# Altium schematic sheet RP2350_MCU.SchDoc
size A3; SheetNumber: 3; SheetTotal: 5
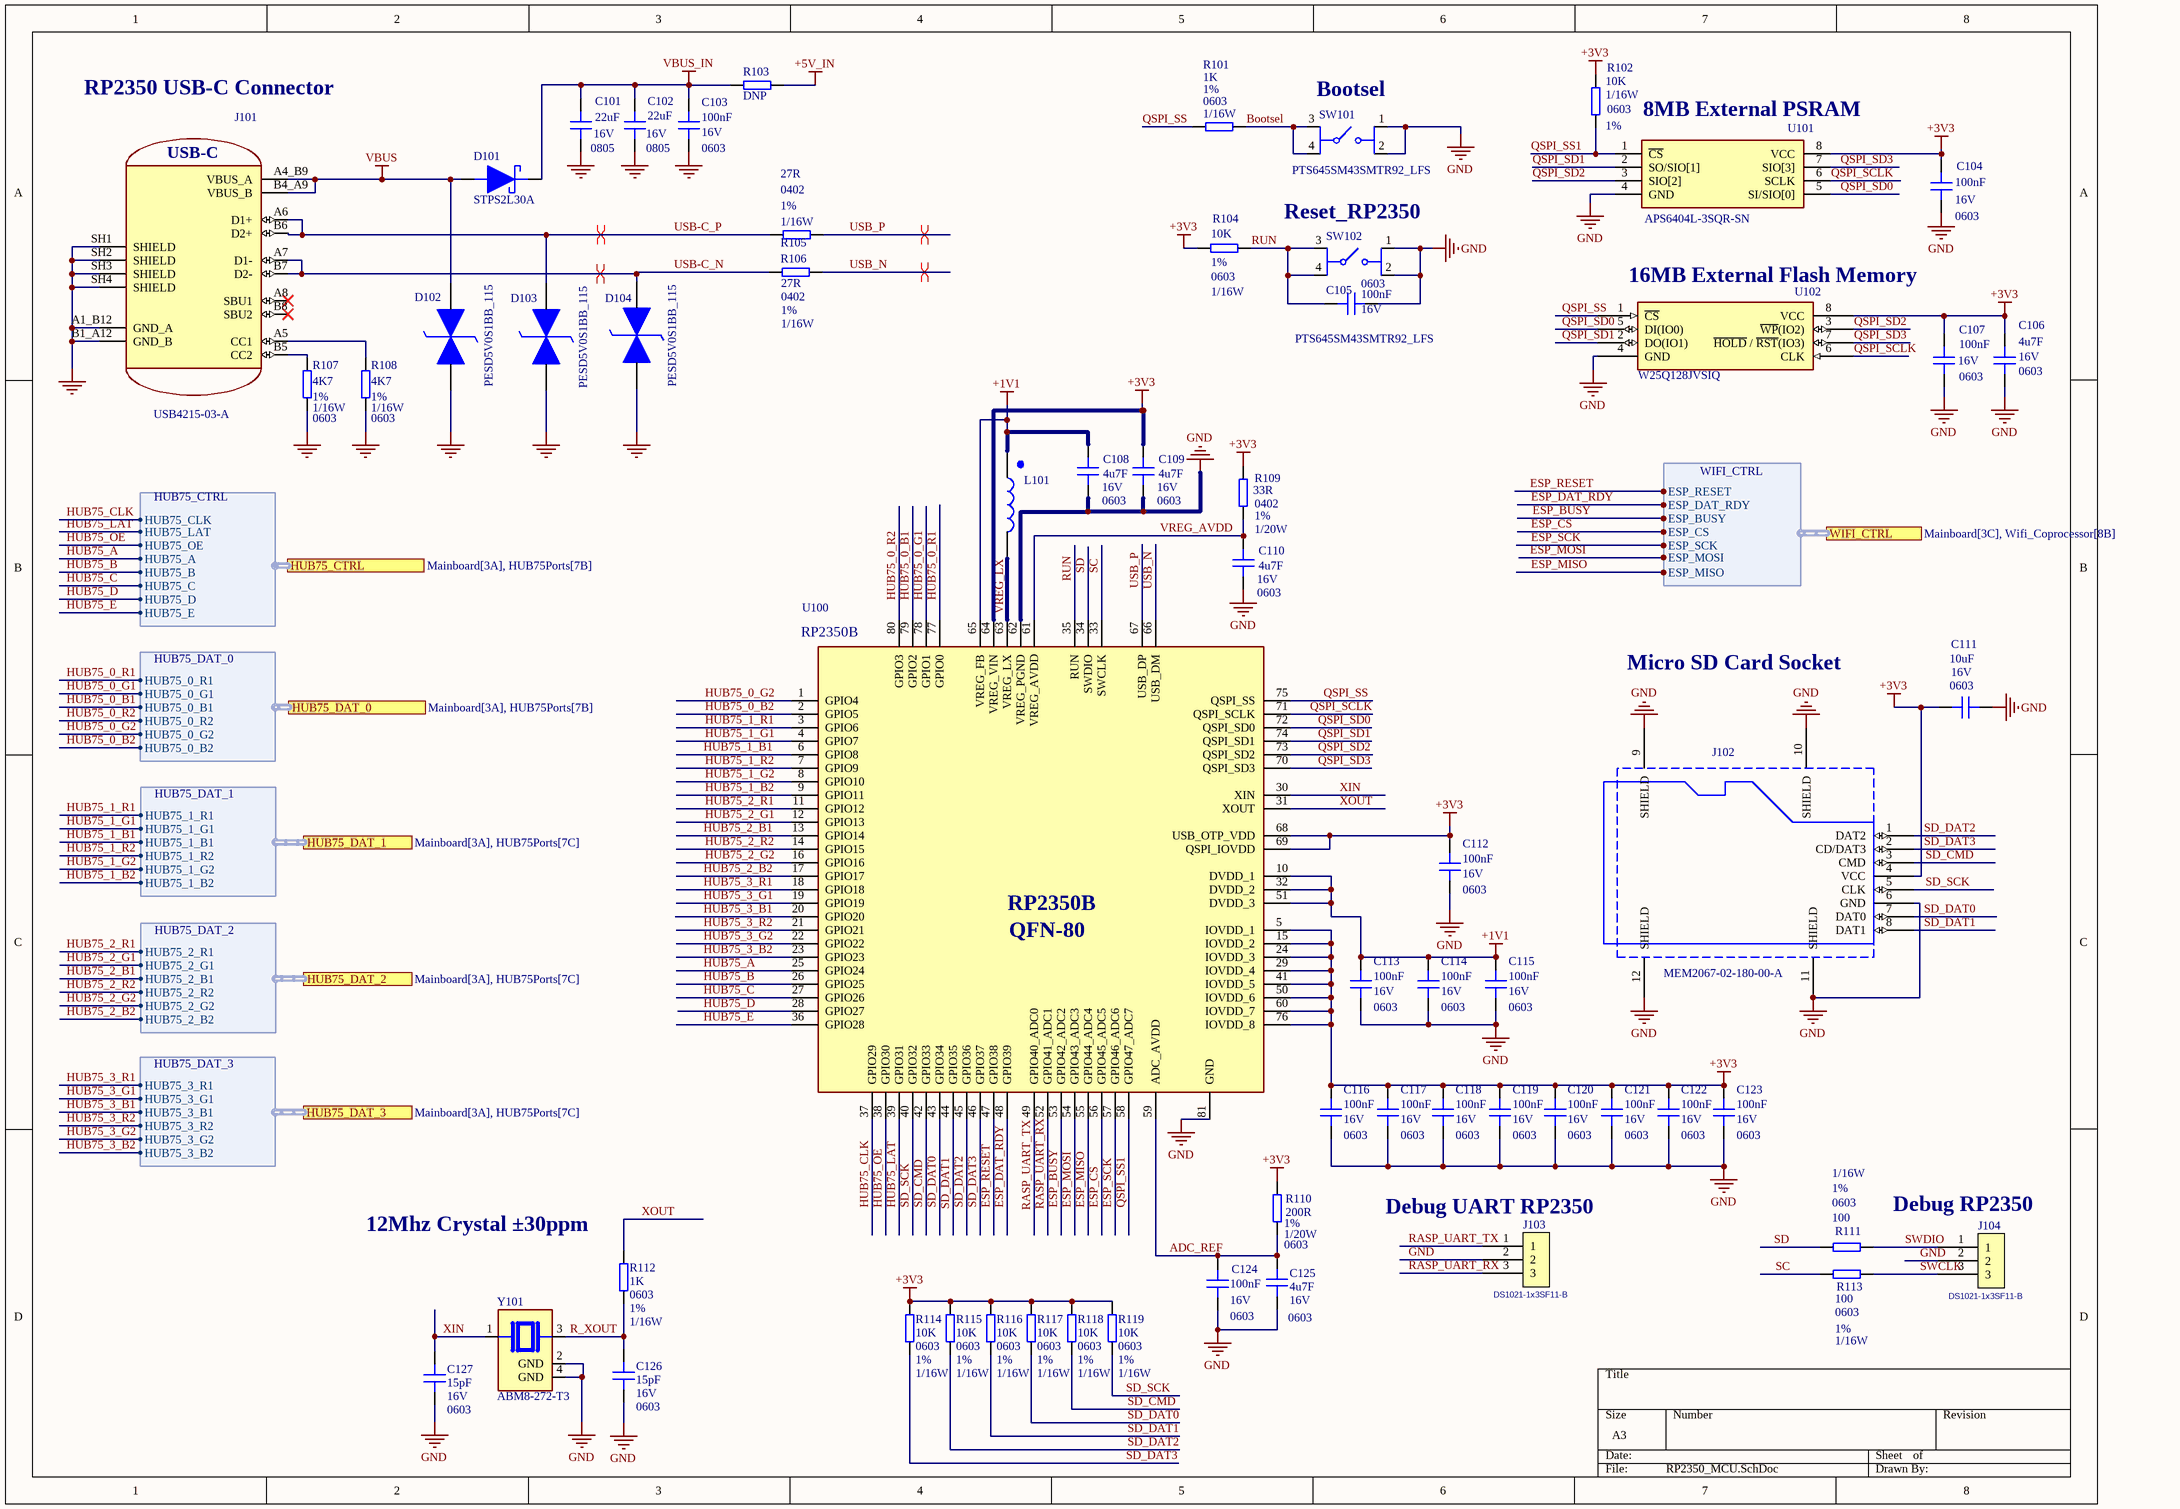
[diagram p0: RP2350_MCU.SchDoc]

## Parts
C101  22uF  Voltage: 16V  Package: 0805  [C0805]
C102  22uF  Voltage: 16V  Package: 0805  [C0805]
C103  100nF  Voltage: 16V  Package: 0603  [C0603]
C104  100nF  Voltage: 16V  Package: 0603  [C0603]
C105  100nF  Voltage: 16V  Package: 0603  [C0603]
C106  4u7F  Voltage: 16V  Package: 0603  [C0603]
C107  100nF  Voltage: 16V  Package: 0603  [C0603]
C108  4u7F  Voltage: 16V  Package: 0603  [C0603]
C109  4u7F  Voltage: 16V  Package: 0603  [C0603]
C110  4u7F  Voltage: 16V  Package: 0603  [C0603]
C111  10uF  Voltage: 16V  Package: 0603  [C0603]
C112  100nF  Voltage: 16V  Package: 0603  [C0402]
C113  100nF  Voltage: 16V  Package: 0603  [C0603]
C114  100nF  Voltage: 16V  Package: 0603  [C0603]
C115  100nF  Voltage: 16V  Package: 0603  [C0603]
C116  100nF  Voltage: 16V  Package: 0603  [C0603]
C117  100nF  Voltage: 16V  Package: 0603  [C0603]
C118  100nF  Voltage: 16V  Package: 0603  [C0603]
C119  100nF  Voltage: 16V  Package: 0603  [C0603]
C120  100nF  Voltage: 16V  Package: 0603  [C0603]
C121  100nF  Voltage: 16V  Package: 0603  [C0603]
C122  100nF  Voltage: 16V  Package: 0603  [C0603]
C123  100nF  Voltage: 16V  Package: 0603  [C0603]
C124  100nF  Voltage: 16V  Package: 0603  [C0603]
C125  4u7F  Voltage: 16V  Package: 0603  [C0603]
C126  15pF  Voltage: 16V  Package: 0603  [C0603]
C127  15pF  Voltage: 16V  Package: 0603  [C0603]
D101  STPS2L30A  [SMA_STM]
D102  PESD5V0S1BB_115  [SODFL1608X65N]
D103  PESD5V0S1BB_115  [SODFL1608X65N]
D104  PESD5V0S1BB_115  [SODFL1608X65N]
J101  USB4215-03-A  [GCT_USB4215-03-A_REVA]
J102  MEM2067-02-180-00-A  [GCT_MEM2067-02-180-00-A_REVB]
J103  DS1021-1x3SF11-B  [HDR-TH_3P-P2.54-V-M]
J104  DS1021-1x3SF11-B  [HDR-TH_3P-P2.54-V-M]
L101  AOTA-B201610S3R3-101-T  [AOTAB201610S3R3101T]  (value not drawn)
R101  1K  Package: 0603  Tolerence: 1%  Power: 1/16W  [R0603_1608]
R102  10K  Package: 0603  Tolerence: 1%  Power: 1/16W  [R0603_1608]
R103  DNP  [R0805_2012]
R104  10K  Package: 0603  Tolerence: 1%  Power: 1/16W  [R0603_1608]
R105  27R  Package: 0402  Tolerence: 1%  Power: 1/16W  [R0402_1005]
R106  27R  Package: 0402  Tolerence: 1%  Power: 1/16W  [R0402_1005]
R107  4K7  Package: 0603  Tolerence: 1%  Power: 1/16W  [R0603_1608]
R108  4K7  Package: 0603  Tolerence: 1%  Power: 1/16W  [R0603_1608]
R109  33R  Package: 0402  Tolerence: 1%  Power: 1/20W  [R0402_1005]
R110  200R  Package: 0603  Tolerence: 1%  Power: 1/20W  [R0603_1608]
R111  100  Package: 0603  Tolerence: 1%  Power: 1/16W  [R0603_1608]
R112  1K  Package: 0603  Tolerence: 1%  Power: 1/16W  [R0603_1608]
R113  100  Package: 0603  Tolerence: 1%  Power: 1/16W  [R0603_1608]
R114  10K  Package: 0603  Tolerence: 1%  Power: 1/16W  [R0603_1608]
R115  10K  Package: 0603  Tolerence: 1%  Power: 1/16W  [R0603_1608]
R116  10K  Package: 0603  Tolerence: 1%  Power: 1/16W  [R0603_1608]
R117  10K  Package: 0603  Tolerence: 1%  Power: 1/16W  [R0603_1608]
R118  10K  Package: 0603  Tolerence: 1%  Power: 1/16W  [R0603_1608]
R119  10K  Package: 0603  Tolerence: 1%  Power: 1/16W  [R0603_1608]
SW101  PTS645SM43SMTR92_LFS  [PTS645SM43SMTR92LFS]
SW102  PTS645SM43SMTR92_LFS  [PTS645SM43SMTR92LFS]
U100  RP2350B  [QFN40P1000X1000X90-81N-D]
U101  APS6404L-3SQR-SN  [SOIC127P600X175-8N]
U102  W25Q128JVSIQ  [SOIC127P790X216-8N]
Y101  ABM8-272-T3  [XTAL_ABM8-272-T3]

## Ports
HUB75_CTRL (harness HUB75_CTRL, see Mainboard[3A], HUB75Ports[7B]), HUB75_DAT_0 (harness HUB75_DAT_0, see Mainboard[3A], HUB75Ports[7B]), HUB75_DAT_1 (harness HUB75_DAT_1, see Mainboard[3A], HUB75Ports[7C]), HUB75_DAT_2 (harness HUB75_DAT_2, see Mainboard[3A], HUB75Ports[7C]), HUB75_DAT_3 (harness HUB75_DAT_3, see Mainboard[3A], HUB75Ports[7C]), WIFI_CTRL (harness WIFI_CTRL, see Mainboard[3C], Wifi_Coprocessor[8B])

## Harnesses
WIFI_CTRL: ESP_RESET, ESP_DAT_RDY, ESP_BUSY, ESP_CS, ESP_SCK, ESP_MOSI, ESP_MISO
HUB75_CTRL: HUB75_CLK, HUB75_LAT, HUB75_OE, HUB75_A, HUB75_B, HUB75_C, HUB75_D, HUB75_E
HUB75_DAT_0: HUB75_0_R1, HUB75_0_G1, HUB75_0_B1, HUB75_0_R2, HUB75_0_G2, HUB75_0_B2
HUB75_DAT_1: HUB75_1_R1, HUB75_1_G1, HUB75_1_B1, HUB75_1_R2, HUB75_1_G2, HUB75_1_B2
HUB75_DAT_2: HUB75_2_R1, HUB75_2_G1, HUB75_2_B1, HUB75_2_R2, HUB75_2_G2, HUB75_2_B2
HUB75_DAT_3: HUB75_3_R1, HUB75_3_G1, HUB75_3_B1, HUB75_3_R2, HUB75_3_G2, HUB75_3_B2

## Nets
+1V1: C108.2 C113.2 C114.2 C115.2 L101.1 U100.10(DVDD_1) U100.32(DVDD_2) U100.51(DVDD_3) U100.65(VREG_FB)
+3V3: C104.2 C106.2 C107.2 C109.2 C111.2 C112.2 C116.2 C117.2 C118.2 C119.2 C120.2 C121.2 C122.2 C123.2 J102.4(VCC) R102.2 R104.1 R109.2 R110.2 R114.1 R115.1 R116.1 R117.1 R118.1 R119.1 U100.5(IOVDD_1) U100.15(IOVDD_2) U100.24(IOVDD_3) U100.29(IOVDD_4) U100.41(IOVDD_5) U100.50(IOVDD_6) U100.60(IOVDD_7) U100.64(VREG_VIN) U100.68(USB_OTP_VDD) U100.69(QSPI_IOVDD) U100.76(IOVDD_8) U101.8(VCC) U102.8(VCC)
+5V_IN: R103.2
GND: C101.1 C102.1 C103.1 C104.1 C105.1 C106.1 C107.1 C108.1 C109.1 C110.1 C111.1 C112.1 C113.1 C114.1 C115.1 C116.1 C117.1 C118.1 C119.1 C120.1 C121.1 C122.1 C123.1 C124.1 C125.1 C126.1 C127.1 D102.1(K1) D103.1(K1) D104.1(K1) J101.A1_B12(GND_A) J101.B1_A12(GND_B) J101.SH1(SHIELD) J101.SH2(SHIELD) J101.SH3(SHIELD) J101.SH4(SHIELD) J102.6(GND) J102.9(SHIELD) J102.10(SHIELD) J102.11(SHIELD) J102.12(SHIELD) J103.2 J104.2 R107.1 R108.1 SW101.1(NO_1) SW101.2(NO_2) SW102.1(NO_1) SW102.2(NO_2) U100.62(VREG_PGND) U100.81(GND) U101.4(GND) U102.4(GND) Y101.2(GND) Y101.4(GND)
VBUS: D101.2(A) D102.2(K2) J101.A4_B9(VBUS_A) J101.B4_A9(VBUS_B)
VBUS_IN: C101.2 C102.2 C103.2 D101.1(K) R103.1
ADC_REF: C124.2 C125.2 R110.1 U100.59(ADC_AVDD)
Bootsel: R101.2 SW101.3(COM_1) SW101.4(COM_2)
ESP_BUSY: U100.53(GPIO42_ADC2) ; port WIFI_CTRL.ESP_BUSY
ESP_CS: U100.56(GPIO45_ADC5) ; port WIFI_CTRL.ESP_CS
ESP_DAT_RDY: U100.48(GPIO39) ; port WIFI_CTRL.ESP_DAT_RDY
ESP_MISO: U100.55(GPIO44_ADC4) ; port WIFI_CTRL.ESP_MISO
ESP_MOSI: U100.54(GPIO43_ADC3) ; port WIFI_CTRL.ESP_MOSI
ESP_RESET: U100.47(GPIO38) ; port WIFI_CTRL.ESP_RESET
ESP_SCK: U100.57(GPIO46_ADC6) ; port WIFI_CTRL.ESP_SCK
HUB75_0_B1: U100.79(GPIO2) ; port HUB75_DAT_0.HUB75_0_B1
HUB75_0_B2: U100.2(GPIO5) ; port HUB75_DAT_0.HUB75_0_B2
HUB75_0_G1: U100.78(GPIO1) ; port HUB75_DAT_0.HUB75_0_G1
HUB75_0_G2: U100.1(GPIO4) ; port HUB75_DAT_0.HUB75_0_G2
HUB75_0_R1: U100.77(GPIO0) ; port HUB75_DAT_0.HUB75_0_R1
HUB75_0_R2: U100.80(GPIO3) ; port HUB75_DAT_0.HUB75_0_R2
HUB75_1_B1: U100.6(GPIO8) ; port HUB75_DAT_1.HUB75_1_B1
HUB75_1_B2: U100.9(GPIO11) ; port HUB75_DAT_1.HUB75_1_B2
HUB75_1_G1: U100.4(GPIO7) ; port HUB75_DAT_1.HUB75_1_G1
HUB75_1_G2: U100.8(GPIO10) ; port HUB75_DAT_1.HUB75_1_G2
HUB75_1_R1: U100.3(GPIO6) ; port HUB75_DAT_1.HUB75_1_R1
HUB75_1_R2: U100.7(GPIO9) ; port HUB75_DAT_1.HUB75_1_R2
HUB75_2_B1: U100.13(GPIO14) ; port HUB75_DAT_2.HUB75_2_B1
HUB75_2_B2: U100.17(GPIO17) ; port HUB75_DAT_2.HUB75_2_B2
HUB75_2_G1: U100.12(GPIO13) ; port HUB75_DAT_2.HUB75_2_G1
HUB75_2_G2: U100.16(GPIO16) ; port HUB75_DAT_2.HUB75_2_G2
HUB75_2_R1: U100.11(GPIO12) ; port HUB75_DAT_2.HUB75_2_R1
HUB75_2_R2: U100.14(GPIO15) ; port HUB75_DAT_2.HUB75_2_R2
HUB75_3_B1: U100.20(GPIO20) ; port HUB75_DAT_3.HUB75_3_B1
HUB75_3_B2: U100.23(GPIO23) ; port HUB75_DAT_3.HUB75_3_B2
HUB75_3_G1: U100.19(GPIO19) ; port HUB75_DAT_3.HUB75_3_G1
HUB75_3_G2: U100.22(GPIO22) ; port HUB75_DAT_3.HUB75_3_G2
HUB75_3_R1: U100.18(GPIO18) ; port HUB75_DAT_3.HUB75_3_R1
HUB75_3_R2: U100.21(GPIO21) ; port HUB75_DAT_3.HUB75_3_R2
HUB75_A: U100.25(GPIO24) ; port HUB75_CTRL.HUB75_A
HUB75_B: U100.26(GPIO25) ; port HUB75_CTRL.HUB75_B
HUB75_C: U100.27(GPIO26) ; port HUB75_CTRL.HUB75_C
HUB75_CLK: U100.37(GPIO29) ; port HUB75_CTRL.HUB75_CLK
HUB75_D: U100.28(GPIO27) ; port HUB75_CTRL.HUB75_D
HUB75_E: U100.36(GPIO28) ; port HUB75_CTRL.HUB75_E
HUB75_LAT: U100.39(GPIO31) ; port HUB75_CTRL.HUB75_LAT
HUB75_OE: U100.38(GPIO30) ; port HUB75_CTRL.HUB75_OE
QSPI_SCLK: U100.71(QSPI_SCLK) U101.6(SCLK) U102.6(CLK)
QSPI_SD0: U100.72(QSPI_SD0) U101.5(SI/SIO[0]) U102.5(DI(IO0))
QSPI_SD1: U100.74(QSPI_SD1) U101.2(SO/SIO[1]) U102.2(DO(IO1))
QSPI_SD2: U100.73(QSPI_SD2) U101.3(SIO[2]) U102.3(~{WP}(IO2))
QSPI_SD3: U100.70(QSPI_SD3) U101.7(SIO[3]) U102.7(~{HOLD}_/_~{RST}(IO3))
QSPI_SS: R101.1 U100.75(QSPI_SS) U102.1(~{CS})
QSPI_SS1: R102.1 U100.58(GPIO47_ADC7) U101.1(~{CS})
R_XOUT: C126.2 R112.2 Y101.3
RASP_UART_RX: J103.3 U100.52(GPIO41_ADC1)
RASP_UART_TX: J103.1 U100.49(GPIO40_ADC0)
RUN: C105.2 R104.2 SW102.3(COM_1) SW102.4(COM_2) U100.35(RUN)
SC: R113.1 U100.33(SWCLK)
SD: R111.1 U100.34(SWDIO)
SD_CMD: J102.3(CMD) R118.2 U100.42(GPIO33)
SD_DAT0: J102.7(DAT0) R117.2 U100.43(GPIO34)
SD_DAT1: J102.8(DAT1) R116.2 U100.44(GPIO35)
SD_DAT2: J102.1(DAT2) R115.2 U100.45(GPIO36)
SD_DAT3: J102.2(CD/DAT3) R114.2 U100.46(GPIO37)
SD_SCK: J102.5(CLK) R119.2 U100.40(GPIO32)
SWCLK: J104.3 R113.2
SWDIO: J104.1 R111.2
USB-C_N: D104.2(K2) J101.A7(D1-) J101.B7(D2-) R106.1
USB-C_P: D103.2(K2) J101.A6(D1+) J101.B6(D2+) R105.1
USB_N: R106.2 U100.66(USB_DM)
USB_P: R105.2 U100.67(USB_DP)
VREG_AVDD: C110.2 R109.1 U100.61(VREG_AVDD)
VREG_LX: L101.2 U100.63(VREG_LX)
XIN: C127.2 U100.30(XIN) Y101.1
XOUT: R112.1 U100.31(XOUT)
NetJ101_A5: J101.A5(CC1) R108.2
NetJ101_B5: J101.B5(CC2) R107.2

Not connected (* = marked no-connect by the designer): J101 A8(SBU1)* B8(SBU2)*

## Layout directives
differential pair; differential pair class DIFF_USB: USB-C_N, USB-C_P, USB_N, USB_P

## Notes on the sheet
- RP2350 USB-C Connector
- (near SW101) Bootsel
- 8MB External PSRAM
- (near SW102) Reset_RP2350
- (near U102) 16MB External Flash Memory
- Micro SD Card Socket
- (near R112) 12Mhz Crystal ±30ppm
- (near J103) Debug UART RP2350
- Debug RP2350
- (in symbol RP2350B) QFN-80
- (in symbol USB4215-03-A) USB-C

## Library data of the parts
C101 C102 = CAP_0805_16V: SMD Capacitor; Designator: ?; Value: 22uF; Dielectric: ?; Manufacturer Reference: ?; Tolerance: ?; Power: ?; Excepted: ?
C103-C105 C107 C113-C124 C126 C127 = CAP_0603_16V: SMD Capacitor; Dielectric: ?; Manufacturer Reference: ?; Tolerance: ?; Power: ?; Excepted: ?
  C103-C105 C107: Designator: ?; Value: 100nF
  C113-C124: Value: 100nF
  C126 C127: Value: 15pF
C106 C108-C111 C125 = CAP_0603_16V: SMD Capacitor; Tolerance: 10%; Temperature Coefficient: X7R; Designator: ?; Dielectric: ?; Manufacturer Reference: ?; Power: ?; Excepted: ?
  C106 C108-C110 C125: Value: 4u7F
  C111: Value: 10uF
C112 = CAP_0402_16V: SMD Capacitor; Value: 100nF; Dielectric: ?; Manufacturer Reference: ?; Tolerance: ?; Power: ?; Excepted: ?
D101 = STPS2L30A: 30 V, 2 A Low Drop Power Schottky Rectifier; Manufacturer_Name: STMicroelectronics; Copyright: Copyright (C) 2025 Ultra Librarian. All rights reserved.; Manufacturer_Part_Number: STPS2L30A
D102-D104 = PESD5V0S1BB_115: PESD5V0S1BB - Bidirectional ESD protection diode; Manufacturer_Name: Nexperia; Manufacturer_Part_Number: PESD5V0S1BB,115; Geometry.Height: 0.65mm; Mouser Part Number: 771-PESD5V0S1BB-T/R; Mouser Price/Stock: https://www.mouser.co.uk/ProductDetail/Nexperia/PESD5V0S1BB115?qs=LOCUfHb8d9vW06zz0pOppQ%3D%3D; Arrow Part Number: PESD5V0S1BB,115; Arrow Price/Stock: https://www.arrow.com/en/products/pesd5v0s1bb115/nexperia?region=nac; Datasheet Link: https://assets.nexperia.com/documents/data-sheet/PESD5V0S1BB.pdf
J101 = USB4215-03-A: USB-C (USB TYPE-C) USB 2.0 Receptacle Connector 24 (16+8 Dummy) Position Surface Mount, Right Angle; Through Hole; MF: Global Connector Technology; SnapEDA_Link: https://www.snapeda.com/parts/USB4215-03-A/Global+Connector+Technology/view-part/?ref=snap; Package: None; Value: *; MP: USB4215-03-A; Check_prices: https://www.snapeda.com/parts/USB4215-03-A/Global+Connector+Technology/view-part/?ref=eda
J102 = MEM2067-02-180-00-A: Micro SD Memory Card ConnectorSMT, Hinged, 1.80mm Profile; MP: MEM2067-02-180-00-A_REVB; Price: None; Value: *; Package: None; Availability: Unavailable
J103 J104 = DS1021-1x3SF11-B: Manufacturer: CONNFLY; Add into BOM: yes; Pin Structure: 1x3P; Pitch: 2.54mm; Circluar Pins/Square Pins: Pin Header; Current Rating: 3A; Voltage Rating (Max): 250V; Symbol: DS1021-1X3SF11-B; Device: DS1021-1x3SF11-B; LCSC Part Name: 1x3P 间距:2.54mm 方针 直插; Supplier Part: C7430359; Manufacturer Part: DS1021-1x3SF11-B; Supplier Footprint: 插件,P=2.54mm; JLCPCB Part Class: Extended Part; Datasheet: https://item.szlcsc.com/datasheet/DS1021-1x3SF11-B/8430012.html; Supplier: LCSC; Convert to PCB: yes; Mounting Type: Through Hole; Number of Rows: 1; Number of Pins: 3P; Contact Material: Copper Alloy; Contact Plating: Gold; Operating Temperature: -40℃~+105℃; Color: Black; Designator: ?; Dielectric: ?; Excepted: ?; Package: ?; Power: ?; Tolerance: ?; Value: ?; Voltage: ?
L101 = AOTA-B201610S3R3-101-T: 3.3 µH Shielded Molded Inductor 2.1 A 140mOhm Max 0806 (2016 Metric); Manufacturer_Name: ABRACON; Geometry.Height: 1mm; Manufacturer_Part_Number: AOTA-B201610S3R3-101-T; Mouser Part Number: 815-AB201610S3R3101T; Mouser Price/Stock: https://www.mouser.co.uk/ProductDetail/ABRACON/AOTA-B201610S3R3-101-T?qs=%252BXxaIXUDbq0IZvJW%2F2mv4w%3D%3D; Arrow Part Number: AOTA-B201610S3R3-101-T; Arrow Price/Stock: https://www.arrow.com/en/products/aota-b201610s3r3-101-t/abracon.html?utm_currency=USD&region=nac; Datasheet Link: https://abracon.com/datasheets/AOTA-B201610S3R3-101-T.pdf
R101 R102 R104-R119 = Resistor: SMD Resistor; Designator: ?; Dielectric: ?; Manufacturer Reference: ?; Excepted: ?
  R101 R112: Value: 1K; Voltage: ?
  R102 R104 R114-R119: Value: 10K; Voltage: ?
  R105 R106: Value: 27R
  R107 R108: Value: 4K7; Voltage: ?
  R109: Value: 33R; Voltage: ?
  R110: Value: 200R; Voltage: ?
  R111 R113: Value: 100; Voltage: ?
R103 = Resistor: SMD Resistor; Tolerence: 1%; Power: 1/16W; Designator: ?; Value: DNP; Voltage: ?; Dielectric: ?; Manufacturer Reference: ?; Package: 0805; Excepted: ?
SW101 SW102 = PTS645SM43SMTR92_LFS: Tactile Switch, PTS645 Series, Top Actuated, Surface Mount, Round Button, 160 gf, 50mA at 12VDC; Manufacturer_Name: LITTELFUSE; Manufacturer_Part_Number: PTS645SM43SMTR92 LFS; Datasheet Link: https://www.ckswitches.com/media/1471/pts645.pdf; Height: 4.4mm; Mouser Part Number: 611-PTS645SM43SMTR92; Mouser Price/Stock: https://www.mouser.co.uk/ProductDetail/CK/PTS645SM43SMTR92-LFS?qs=Imq1NPwxi75hrUk5xRQGSg%3D%3D; Arrow Part Number: PTS645SM43SMTR92 LFS; Arrow Price/Stock: https://www.arrow.com/en/products/pts645sm43smtr92lfs/ck?utm_currency=USD&region=nac
U100 = RP2350B: Dual Arm Cortex-M33 or dual Hazard3 RISC-V processors @ 150MHz; Manufacturer_Name: RASPBERRY-PI; Geometry.Height: 0.9mm; Manufacturer_Part_Number: RP2350B; Mouser Part Number: *; Mouser Price/Stock: *; Arrow Part Number: *; Arrow Price/Stock: *; Datasheet Link: https://datasheets.raspberrypi.com/rp2350/rp2350-product-brief.pdf
U101 = APS6404L-3SQR-SN: DRAM IoT RAM 64Mb QSPI (x1,x4) SDR 133/84MHz, RBX, 3V, Ind. Temp., SOP8; Manufacturer_Name: AP Memory; Geometry.Height: 1.75mm; Manufacturer_Part_Number: APS6404L-3SQR-SN; Mouser Part Number: 878-APS6404L-3SQR-SN; Mouser Price/Stock: https://www.mouser.co.uk/ProductDetail/AP-Memory/APS6404L-3SQR-SN?qs=IS%252B4QmGtzzqsn3S5xo%2FEEg%3D%3D; Arrow Part Number: *; Arrow Price/Stock: *; Datasheet Link: https://eu.mouser.com/datasheet/2/1127/APM_PSRAM_QSPI_APS6404L_3SQR_v2_3_PKG-1954826.pdf
U102 = W25Q128JVSIQ: FLASH - NOR Memory IC 128Mb (16M x 8) SPI - Quad I/O, QPI, DTR 133 MHz 8-SOIC; MF: Winbond Electronics; SnapEDA_Link: https://www.snapeda.com/parts/W25Q128JVSIQ/Winbond/view-part/?ref=snap; Package: SOIC-8 Winbond Electronics; Value: *; MP: W25Q128JVSIQ; Check_prices: https://www.snapeda.com/parts/W25Q128JVSIQ/Winbond/view-part/?ref=eda
Y101 = ABM8-272-T3: 12 MHz Â±30ppm Crystal 10pF 50 Ohms 4-SMD, No Lead; MF: ABRACON; SnapEDA_Link: https://www.snapeda.com/parts/ABM8-272-T3/Abracon/view-part/?ref=snap; Package: NON-STANDARD-4 Abracon; Value: *; MP: ABM8-272-T3; Check_prices: https://www.snapeda.com/parts/ABM8-272-T3/Abracon/view-part/?ref=eda